# Altium schematic sheet Top-Sheet.SchDoc
size A4; SheetNumber: 1; SheetTotal: 5
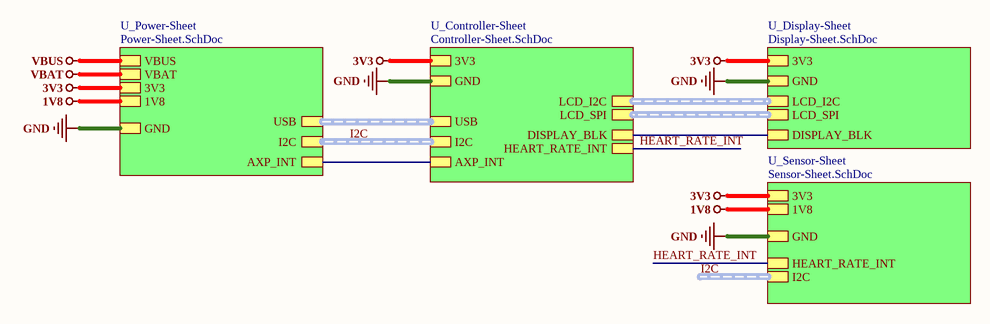
[diagram p0: Top-Sheet.SchDoc]

## Sub-sheets
U_Controller-Sheet = Controller-Sheet.SchDoc: LCD_I2C (harness LCD_I2C), USB (harness USB), LCD_SPI (harness LCD_SPI), DISPLAY_BLK, HEART_RATE_INT, GND, 3V3, AXP_INT, I2C (harness I2C)
U_Display-Sheet = Display-Sheet.SchDoc: LCD_SPI (harness LCD_SPI), DISPLAY_BLK, LCD_I2C (harness LCD_I2C), GND, 3V3
U_Power-Sheet = Power-Sheet.SchDoc: USB (harness USB), I2C (harness I2C), GND, 1V8, 3V3, VBAT, VBUS, AXP_INT
U_Sensor-Sheet = Sensor-Sheet.SchDoc: GND, 1V8, 3V3, HEART_RATE_INT, I2C (harness I2C)

## Nets
1V8: sheet U_Power-Sheet/1V8, sheet U_Sensor-Sheet/1V8
3V3: sheet U_Power-Sheet/3V3, sheet U_Controller-Sheet/3V3, sheet U_Display-Sheet/3V3, sheet U_Sensor-Sheet/3V3
GND: sheet U_Power-Sheet/GND, sheet U_Controller-Sheet/GND, sheet U_Display-Sheet/GND, sheet U_Sensor-Sheet/GND
VBAT: sheet U_Power-Sheet/VBAT
VBUS: sheet U_Power-Sheet/VBUS
HEART_RATE_INT: sheet U_Controller-Sheet/HEART_RATE_INT, sheet U_Sensor-Sheet/HEART_RATE_INT
(unnamed): sheet U_Power-Sheet/AXP_INT, sheet U_Controller-Sheet/AXP_INT
(unnamed): sheet U_Controller-Sheet/DISPLAY_BLK, sheet U_Display-Sheet/DISPLAY_BLK

## Buses and harness runs
harness I2C = sheet U_Controller-Sheet/I2C = sheet U_Power-Sheet/I2C
harness I2C = sheet U_Sensor-Sheet/I2C
harness sheet U_Controller-Sheet/LCD_I2C = sheet U_Display-Sheet/LCD_I2C
harness sheet U_Controller-Sheet/LCD_SPI = sheet U_Display-Sheet/LCD_SPI
harness sheet U_Controller-Sheet/USB = sheet U_Power-Sheet/USB

## Notes on the sheet
- File:
- Title:
- Date:
- Page
- Num:
- Total:
- Drawn By: Huzaifa Ali